# Altium project Touch_Board_LD.PrjPcb
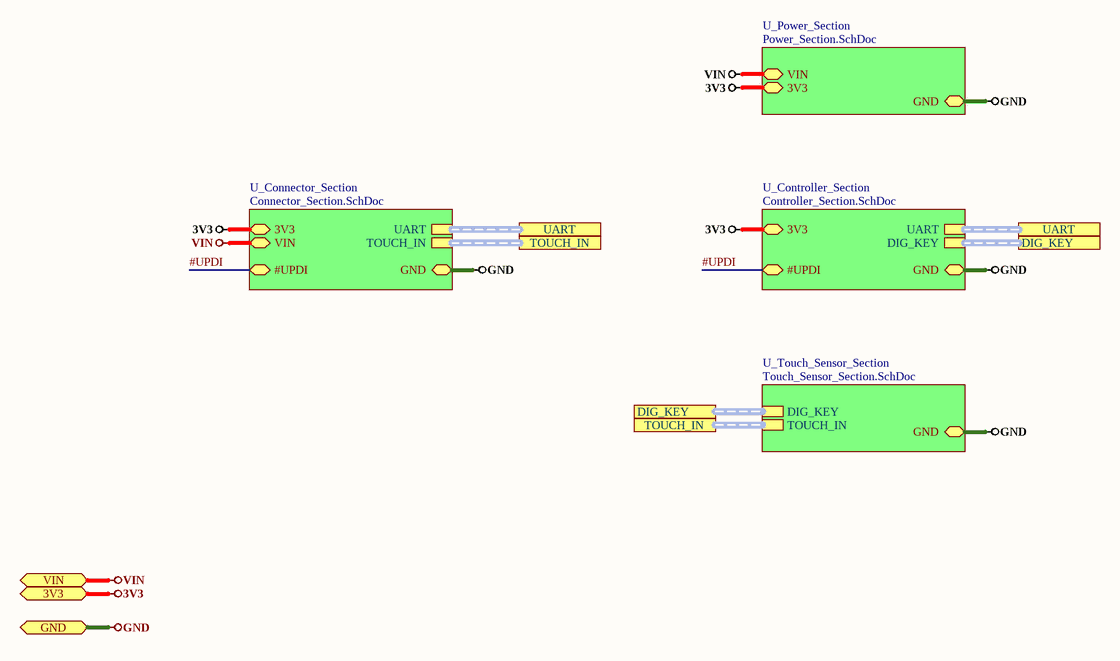
[diagram p0: Top_Sheet.SchDoc]
5 sheets, 34 parts. Net scope: hierarchical (ports join the sheet entries above them; power ports are global).
Board file: Touch_Board_LD.PcbDoc
Sheets:
  Top_Sheet.SchDoc
    U_Connector_Section = Connector_Section.SchDoc
    U_Controller_Section = Controller_Section.SchDoc
    U_Power_Section = Power_Section.SchDoc
    U_Touch_Sensor_Section = Touch_Sensor_Section.SchDoc

## Sheet Top_Sheet.SchDoc
size A4

### Sub-sheets
U_Connector_Section = Connector_Section.SchDoc: 3V3 (bidir), GND (bidir), UART (harness UART_Harness), #UPDI (bidir), TOUCH_IN (harness Touch_Harness), VIN (bidir)
U_Controller_Section = Controller_Section.SchDoc: 3V3 (bidir), GND (bidir), UART (harness UART_Harness), #UPDI (bidir), DIG_KEY (harness Cap_Harness)
U_Power_Section = Power_Section.SchDoc: VIN (bidir), GND (bidir), 3V3 (bidir)
U_Touch_Sensor_Section = Touch_Sensor_Section.SchDoc: GND (bidir), DIG_KEY (harness Cap_Harness), TOUCH_IN (harness Touch_Harness)

### Ports
3V3 (bidir), DIG_KEY (harness Cap_Harness), GND (bidir), TOUCH_IN (harness Touch_Harness), UART (harness UART_Harness), VIN (bidir)

### Nets
3V3: port 3V3, sheet U_Connector_Section/3V3, sheet U_Controller_Section/3V3, sheet U_Power_Section/3V3
GND: port GND, sheet U_Connector_Section/GND, sheet U_Controller_Section/GND, sheet U_Power_Section/GND, sheet U_Touch_Sensor_Section/GND
VIN: port VIN, sheet U_Connector_Section/VIN, sheet U_Power_Section/VIN
#UPDI: sheet U_Connector_Section/#UPDI, sheet U_Controller_Section/#UPDI

### Buses and harness runs
harness port DIG_KEY = sheet U_Controller_Section/DIG_KEY
harness port DIG_KEY = sheet U_Touch_Sensor_Section/DIG_KEY
harness port TOUCH_IN = sheet U_Connector_Section/TOUCH_IN
harness port TOUCH_IN = sheet U_Touch_Sensor_Section/TOUCH_IN
harness port UART = sheet U_Connector_Section/UART
harness port UART = sheet U_Controller_Section/UART

## Sheet Connector_Section.SchDoc
size A4
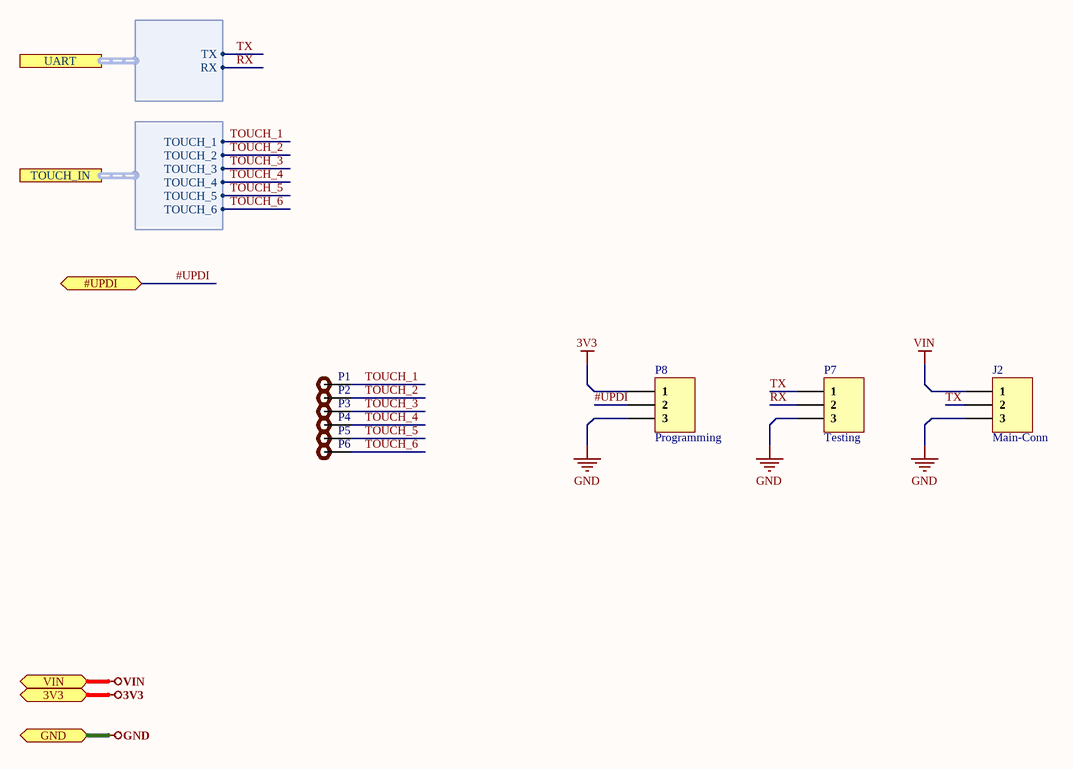
[diagram p1: Connector_Section.SchDoc]

### Parts
J2  Main-Conn  [S3B-XH-A-1(LF)(SN)]
P1  Test Point  [TEST POINT]  (value not drawn)
P2  Test Point  [TEST POINT]  (value not drawn)
P3  Test Point  [TEST POINT]  (value not drawn)
P4  Test Point  [TEST POINT]  (value not drawn)
P5  Test Point  [TEST POINT]  (value not drawn)
P6  Test Point  [TEST POINT]  (value not drawn)
P7  Testing  [HDR1X3]
P8  Programming  [HDR1X3]

### Ports
3V3 (bidir), #UPDI (bidir), GND (bidir), TOUCH_IN (harness Touch_Harness), UART (harness UART_Harness), VIN (bidir)

### Harnesses
UART_Harness: TX, RX
Touch_Harness: TOUCH_1, TOUCH_2, TOUCH_3, TOUCH_4, TOUCH_5, TOUCH_6

### Nets
3V3: P8.1 ; port 3V3
GND: J2.3 P7.3 P8.3 ; port GND
VIN: J2.1 ; port VIN
#UPDI: P8.2 ; port #UPDI
RX: P7.2 ; port UART.RX
TOUCH_1: P1.1 ; port TOUCH_IN.TOUCH_1
TOUCH_2: P2.1 ; port TOUCH_IN.TOUCH_2
TOUCH_3: P3.1 ; port TOUCH_IN.TOUCH_3
TOUCH_4: P4.1 ; port TOUCH_IN.TOUCH_4
TOUCH_5: P5.1 ; port TOUCH_IN.TOUCH_5
TOUCH_6: P6.1 ; port TOUCH_IN.TOUCH_6
TX: J2.2 P7.1 ; port UART.TX

### Library data of the parts
J2 = S3B-XH-A-1(LF)(SN): CONN HEADER XH SIDE 3POS 2.5MM; Manufacturer: JST; Connector Type: Male Pin; Number of Positions: 3; Pitch: 0.098inch; Supplier 1: Digi-Key; Manufacturer Part Number: S3B-XH-A-1(LF)(SN); RoHS: Yes; Category: Connectors; Pricing 1: 1=0.22000, 10=0.20900, 100=0.14520, 500=0.12282, 1000=0.10049, 5000=0.08933, 10000=0.08095 (USD); Mount: Through Hole; Color: Natural; Contact Plating: Tin; Termination: Press-Fit; Package Quantity: 1000; Number of Rows: 1; Packaging: Bulk; Fastening Type: Detent; Lead Free: Lead Free; ComponentLink1URL: https://datasheet.ciiva.com/725/exh-725857.pdf?src-supplier=Digi-Key; ComponentLink1Description: https://datasheet.ciiva.com/725/exh-725857.pdf?src-supplier=Digi-Key; ComponentLink2URL: https://datasheet.ciiva.com/16484/ejq-16484618.pdf?src-supplier=Future+Electronics; ComponentLink2Description: https://datasheet.ciiva.com/16484/ejq-16484618.pdf?src-supplier=Future+Electronics; Supplier Part Number 1: 455-2954-ND
P1-P6 = TEST POINT: Test Point ON
P7 P8 = Header 3: CONN HEADER VERT 3POS 2.54MM; Manufacturer: Wurth Electronics; Manufacturer Part Number: 61300311121; Number of Positions: 3; Gender: Male; Connector Type: Male Pin; Pitch: 0.1inch; Supplier 1: Digi-Key; Stock 1: 81286; Pricing 1: 1=0.13, 10=0.106, 25=0.088, 50=0.074, 100=0.067, 1000=0.061 (USD); Mount: Through Hole; Contact Plating: Gold; Contact Material: Copper; Color: Black; Number of Rows: 1; Packaging: Bulk; Termination: Solder; Number of Contacts: 3; Contact Mating Length: 0.236inch; REACH SVHC: Unknown; Lead Free: Lead Free; ComponentLink1URL: http://www.farnell.com/cad/1737268.pdf?src-supplier=Element14; ComponentLink1Description: http://www.farnell.com/cad/1737268.pdf?src-supplier=Element14; ComponentLink2URL: https://katalog.we-online.de/em/datasheet/6130xx11121.pdf?src-supplier=Digi-Key; ComponentLink2Description: https://katalog.we-online.de/em/datasheet/6130xx11121.pdf?src-supplier=Digi-Key; Supplier Part Number 1: 732-5316-ND

## Sheet Controller_Section.SchDoc
size A4
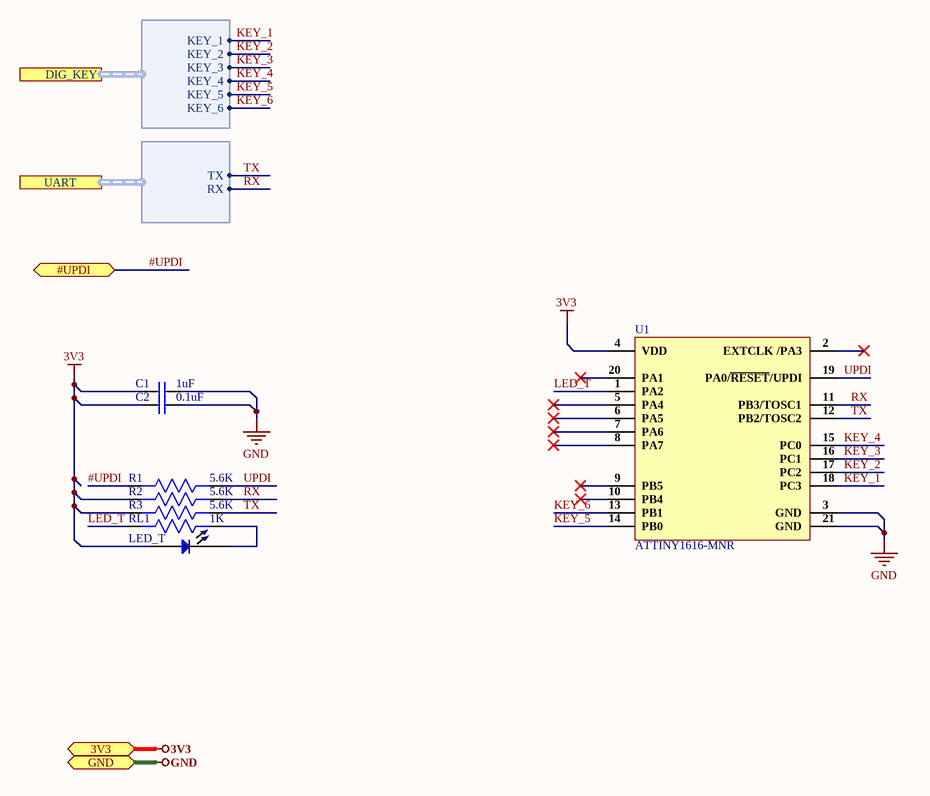
[diagram p2: Controller_Section.SchDoc]

### Parts
C1  1uF  [Cap0603]
C2  0.1uF  [Cap0805]
LED_T  150080GS75000  [LED 0805]  (value not drawn)
R1  5.6K  [RES 0805]
R2  5.6K  [RES 0805]
R3  5.6K  [RES 0805]
RL1  1K  [RES 0805]
U1  ATTINY1616-MNR  [20-QFN]

### Ports
3V3 (bidir), #UPDI (bidir), DIG_KEY (harness Cap_Harness), GND (bidir), UART (harness UART_Harness)

### Harnesses
Cap_Harness: KEY_1, KEY_2, KEY_3, KEY_4, KEY_5, KEY_6
UART_Harness: TX, RX

### Nets
3V3: C1.1 C2.1 LED_T.1 R2.2 R3.2 U1.4(VDD) ; port 3V3
GND: C1.2 C2.2 U1.3(GND) U1.21(GND) ; port GND
#UPDI: R1.2 ; port #UPDI
KEY_1: U1.18(PC3) ; port DIG_KEY.KEY_1
KEY_2: U1.17(PC2) ; port DIG_KEY.KEY_2
KEY_3: U1.16(PC1) ; port DIG_KEY.KEY_3
KEY_4: U1.15(PC0) ; port DIG_KEY.KEY_4
KEY_5: U1.14(PB0) ; port DIG_KEY.KEY_5
KEY_6: U1.13(PB1) ; port DIG_KEY.KEY_6
LED_T: RL1.2 U1.1(PA2)
RX: R2.1 U1.11(PB3/TOSC1) ; port UART.RX
TX: R3.1 U1.12(PB2/TOSC2) ; port UART.TX
UPDI: R1.1 U1.19(PA0/~{RESET}/UPDI)
NetLED_T_2: LED_T.2 RL1.1

Not connected (* = marked no-connect by the designer): U1 2(EXTCLK_/PA3)* 5(PA4)* 6(PA5)* 7(PA6)* 8(PA7)* 9(PB5)* 10(PB4)* 20(PA1)*

### Library data of the parts
C1 = CC0603KRX5R8BB105: CAP CER 1UF 25V X5R 0603; Manufacturer: Yageo; Tolerance: 10%; Supplier 1: Digi-Key; Manufacturer Part Number: CC0603KRX5R8BB105; RoHS: Yes; Category: Ceramic Capacitors; Stock 1: 919939; Pricing 1: 1=0.12000, 10=0.08400, 50=0.04760, 100=0.03940, 500=0.02764, 1000=0.02288 (USD); Mount: Surface Mount; Case/Package: 0603; Number of Pins: 2; Case Code (Metric): 1608; Case Code (Imperial): 0603; Min Operating Temperature: -55°C; Max Operating Temperature: 85°C; Capacitance: 1uF; Dielectric: X5R; Package Quantity: 1; Voltage Rating: 25V; Packaging: Tape and Reel; Termination: SMD/SMT; Voltage Rating (DC): 25V; Series: CC; Construction: Flat; Length: 1.6mm; Width: 0.031inch; Height: 0.8mm; Thickness: 0.035inch; Depth: 0.8mm; Radiation Hardening: No; REACH SVHC: No SVHC; Lead Free: Lead Free; Halogen Free: Halogen Free; RoHS Compliant: Yes; ComponentLink1URL: https://datasheet.ciiva.com/176/mlccorderingcode-176785.pdf?src-supplier=Digi-Key; ComponentLink1Description: https://datasheet.ciiva.com/176/mlccorderingcode-176785.pdf?src-supplier=Digi-Key; ComponentLink2URL: https://datasheet.ciiva.com/176/mlccorderingcode-176786.pdf?src-supplier=Digi-Key; ComponentLink2Description: https://datasheet.ciiva.com/176/mlccorderingcode-176786.pdf?src-supplier=Digi-Key; ComponentLink3URL: https://datasheet.ciiva.com/176/mlccorderingcode-176787.pdf?src-supplier=Digi-Key; ComponentLink3Description: https://datasheet.ciiva.com/176/mlccorderingcode-176787.pdf?src-supplier=Digi-Key; ComponentLink4URL: https://datasheet.ciiva.com/17436/upy-gphc-x5r-4v-to-50v-12-17436952.pdf?src-supplier=Avnet+Europe; ComponentLink4Description: https://datasheet.ciiva.com/17436/upy-gphc-x5r-4v-to-50v-12-17436952.pdf?src-supplier=Avnet+Europe; ComponentLink5URL: https://datasheet.ciiva.com/7978/1525783-7978171.pdf?src-supplier=Element14; ComponentLink5Description: https://datasheet.ciiva.com/7978/1525783-7978171.pdf?src-supplier=Element14; ComponentLink6URL: https://datasheet.ciiva.com/11586/upy-gphc-x5r-4v-to-50v-12-11586318.pdf?src-supplier=Avnet; ComponentLink6Description: https://datasheet.ciiva.com/11586/upy-gphc-x5r-4v-to-50v-12-11586318.pdf?src-supplier=Avnet; Supplier Part Number 1: 311-1445-1-ND
C2 = 0805B104K500CT: CAP CER 0.1UF 50V X7R 0805; Manufacturer: Walsin Technologies; Tolerance: 10%; Capacitance: 100nF; Supplier 1: Digi-Key; Manufacturer Part Number: 0805B104K500CT; RoHS: Yes; Category: Ceramic Capacitors; Stock 1: 1274242; Pricing 1: 1=0.12000, 10=0.08600, 50=0.04900, 100=0.04050, 500=0.02842, 1000=0.02352 (USD); Case/Package: 0805; Case Code (Imperial): 0805; Case Code (Metric): 2012; Min Operating Temperature: -55°C; Max Operating Temperature: 125°C; Packaging: Tape and Reel; Voltage Rating: 50V; Dielectric: X7R; Voltage Rating (DC): 50V; Voltage: 50V; Length: 2mm; Depth: 1.25mm; Radiation Hardening: No; REACH SVHC: Unknown; Lead Free: Lead Free; ComponentLink1URL: http://www.farnell.com/datasheets/2340522.pdf?src-supplier=Farnell; ComponentLink1Description: http://www.farnell.com/datasheets/2340522.pdf?src-supplier=Farnell; ComponentLink2URL: http://components.arrow.com/part/dataview/0323_00650840?src-supplier=Arrow+Europe; ComponentLink2Description: http://components.arrow.com/part/dataview/0323_00650840?src-supplier=Arrow+Europe; ComponentLink3URL: https://www.verical.com/server-webapp/html/getDatasheet?partID=414849&src-supplier=Verical; ComponentLink3Description: https://www.verical.com/server-webapp/html/getDatasheet?partID=414849&src-supplier=Verical; ComponentLink4URL: http://www.farnell.com/datasheets/2340522.pdf?src-supplier=Element14; ComponentLink4Description: http://www.farnell.com/datasheets/2340522.pdf?src-supplier=Element14; ComponentLink5URL: http://www.passivecomponent.com/wp-content/uploads/2018/10/MLCC.pdf?src-supplier=Digi-Key; ComponentLink5Description: http://www.passivecomponent.com/wp-content/uploads/2018/10/MLCC.pdf?src-supplier=Digi-Key; ComponentLink6URL: http://www.passivecomponent.com/indexsea/0805B104K500CT-IB.pdf?src-supplier=Digi-Key; ComponentLink6Description: http://www.passivecomponent.com/indexsea/0805B104K500CT-IB.pdf?src-supplier=Digi-Key; ComponentLink7URL: http://www.farnell.com/datasheets/2340522.pdf?src-supplier=Newark; ComponentLink7Description: http://www.farnell.com/datasheets/2340522.pdf?src-supplier=Newark; Supplier Part Number 1: 1292-1647-1-ND
LED_T = 150080GS75000: LED GREEN CLEAR 0805 SMD; Manufacturer: Wurth Electronics; Viewing Angle: 140°; Lens Style: Clear,Rectangular; Luminous Intensity: 450mcd; Forward Voltage: 3.2V; Wavelength: 520nm; Forward Current: 30mA; Test Current: 20mA; Supplier 1: Digi-Key; Manufacturer Part Number: 150080GS75000; RoHS: Yes; Category: LEDs; Stock 1: 96823; Pricing 1: 1=0.18000, 50=0.16500, 100=0.14200, 500=0.12300 (USD); Mount: Surface Mount; Case/Package: 0805; Color: Green; Case Code (Metric): 2012; Case Code (Imperial): 0805; Min Operating Temperature: -40°C; Max Operating Temperature: 85°C; Package Quantity: 4000; Packaging: Cut Tape; Dominant Wavelength: 520nm; Length: 2mm; Width: 1.25mm; Height: 0.7mm; REACH SVHC: Unknown; RoHS Compliant: Yes; ComponentLink1URL: https://datasheet.ciiva.com/29563/150080gs75000-29563008.pdf?src-supplier=Digi-Key; ComponentLink1Description: https://datasheet.ciiva.com/29563/150080gs75000-29563008.pdf?src-supplier=Digi-Key; ComponentLink2URL: https://datasheet.ciiva.com/29279/759434-da-01-en-chipled-0805-w-kl-gruen-150080gs75000-29279039.pdf?src-supplier=Conrad; ComponentLink2Description: https://datasheet.ciiva.com/29279/759434-da-01-en-chipled-0805-w-kl-gruen-150080gs75000-29279039.pdf?src-supplier=Conrad; Supplier Part Number 1: 732-4983-1-ND
R1-R3 = ERJ6ENF5601V: RES SMD 5.6K Ohm 1% 0805; Manufacturer: Panasonic; Manufacturer Part Number: ERJ-6ENF5601V; Resistance: 5.6kR; Temperature Coefficient: 100ppm/°C; Power Rating: 125mW; Voltage Rating: 150V; Supplier 1: Digi-Key; RoHS: Yes; Category: Chip SMD Resistors; Stock 1: 4806; Pricing 1: 1=0.10000, 10=0.07500, 100=0.02880, 1000=0.01265, 2500=0.01092 (USD); Mount: Surface Mount; Case/Package: 0805; Number of Pins: 2; Contact Plating: Tin; Case Code (Metric): 2012; Case Code (Imperial): 0805; Min Operating Temperature: -55°C; Max Operating Temperature: 155°C; Tolerance: 1%; Resistor Type: Thick Film; Packaging: Tape and Reel; Package Quantity: 1; Number of Terminations: 2; Termination: SMD/SMT; Max Power Dissipation: 125mW; Voltage Rating (DC): 150V; Features: Automotive AEC-Q200; Series: ERJ; Technology: THICK FILM; Resistance Tolerance: 1%; Construction: Rectangular; Length: 2mm; Width: 0.049inch; Height: 0.6mm; Depth: 1.25mm; Radiation Hardening: No; REACH SVHC: No SVHC; Military Standard: Not; Lead Free: Lead Free; RoHS Compliant: Yes; ComponentLink1URL: https://datasheet.ciiva.com/11821/0900766b80f80784-11821697.pdf?src-supplier=RSComponents; ComponentLink1Description: https://datasheet.ciiva.com/11821/0900766b80f80784-11821697.pdf?src-supplier=RSComponents; ComponentLink2URL: https://datasheet.ciiva.com/9195/aoa0000ce2-9195464.pdf?src-supplier=Avnet; ComponentLink2Description: https://datasheet.ciiva.com/9195/aoa0000ce2-9195464.pdf?src-supplier=Avnet; ComponentLink3URL: https://datasheet.ciiva.com/6138/426256-6138793.pdf?src-supplier=Farnell; ComponentLink3Description: https://datasheet.ciiva.com/6138/426256-6138793.pdf?src-supplier=Farnell; ComponentLink4URL: https://datasheet.ciiva.com/30195/aoa0000ce2-30195103.pdf?src-supplier=Onlinecomponents.com; ComponentLink4Description: https://datasheet.ciiva.com/30195/aoa0000ce2-30195103.pdf?src-supplier=Onlinecomponents.com; ComponentLink5URL: https://datasheet.ciiva.com/17212/aoa0000ce2-17212901.pdf?src-supplier=Avnet+Europe; ComponentLink5Description: https://datasheet.ciiva.com/17212/aoa0000ce2-17212901.pdf?src-supplier=Avnet+Europe; ComponentLink6URL: https://datasheet.ciiva.com/22737/426256-22737287.pdf?src-supplier=Element14; ComponentLink6Description: https://datasheet.ciiva.com/22737/426256-22737287.pdf?src-supplier=Element14; ComponentLink7URL: https://datasheet.ciiva.com/46420/1678782-46420327.pdf?src-supplier=Element14; ComponentLink7Description: https://datasheet.ciiva.com/46420/1678782-46420327.pdf?src-supplier=Element14; ComponentLink8URL: https://datasheet.ciiva.com/16784/70260748-16784840.pdf?src-supplier=Allied+Electronics; ComponentLink8Description: https://datasheet.ciiva.com/16784/70260748-16784840.pdf?src-supplier=Allied+Electronics; ComponentLink9URL: https://datasheet.ciiva.com/16771/70260748-16771098.pdf?src-supplier=Allied+Electronics; ComponentLink9Description: https://datasheet.ciiva.com/16771/70260748-16771098.pdf?src-supplier=Allied+Electronics; ComponentLink10URL: https://datasheet.ciiva.com/16512/aoa0000ce2-16512011.pdf?src-supplier=Avnet+Asia; ComponentLink10Description: https://datasheet.ciiva.com/16512/aoa0000ce2-16512011.pdf?src-supplier=Avnet+Asia; ComponentLink11URL: https://datasheet.ciiva.com/22673/1678782-22673707.pdf?src-supplier=Element14; ComponentLink11Description: https://datasheet.ciiva.com/22673/1678782-22673707.pdf?src-supplier=Element14; ComponentLink12URL: https://datasheet.ciiva.com/24024/aoa0000ce2-24024829.pdf?src-supplier=Mouser; ComponentLink12Description: https://datasheet.ciiva.com/24024/aoa0000ce2-24024829.pdf?src-supplier=Mouser; Supplier Part Number 1: P5.60KCCT-ND
RL1 = CRCW08051K00JNEB: RES SMD 1K OHM 5% 1/8W 0805; Manufacturer: Vishay Dale; Resistance: 1kR; Power Rating: 125mW; Voltage Rating: 150V; Temperature Coefficient: 200ppm/°C; Supplier 1: Digi-Key; Manufacturer Part Number: CRCW08051K00JNEB; RoHS: Yes; Category: Chip SMD Resistors; Stock 1: 4389; Pricing 1: 1=0.10000, 10=0.05000, 100=0.02040, 1000=0.00914, 2500=0.00794, 5000=0.00656 (USD); Case/Package: 0805; Number of Pins: 2; Weight: 0.000194oz; Case Code (Imperial): 0805; Case Code (Metric): 2012; Contact Plating: Tin; Min Operating Temperature: -55°C; Max Operating Temperature: 155°C; Packaging: Tape and Reel; Tolerance: 5%; Package Quantity: 10000; Resistor Type: Thick Film; Number of Terminations: 2; Termination: SMD/SMT; Max Power Dissipation: 125mW; Voltage Rating (DC): 150V; Features: Automotive AEC-Q200; Length: 0.079inch; Width: 0.049inch; Height: 0.02inch; Radiation Hardening: No; REACH SVHC: Unknown; Lead Free: Lead Free; ComponentLink1URL: https://datasheet.ciiva.com/5548/dcrcwe3-109170-5548326.pdf?src-supplier=Mouser; ComponentLink1Description: https://datasheet.ciiva.com/5548/dcrcwe3-109170-5548326.pdf?src-supplier=Mouser; ComponentLink2URL: https://datasheet.ciiva.com/28621/1747939-28621434.pdf?src-supplier=Element14; ComponentLink2Description: https://datasheet.ciiva.com/28621/1747939-28621434.pdf?src-supplier=Element14; Supplier Part Number 1: 541-CRCW08051K00JNEBCT-ND
U1 = ATTINY1616-MNR: IC MCU 8BIT 16KB FLASH 20VQFN; Manufacturer: Microchip; Interface: I2C,SPI,IrDA,UART,USART; Peripherals: Brown-out Detect/Reset,POR,PWM,WDT; Core Architecture: AVR; Frequency: 20MHz; Number of I/Os: 18; Oscillator Type: Internal; Supplier 1: Digi-Key; Manufacturer Part Number: ATTINY1616-MNR; RoHS: No; Category: Microcontrollers; Stock 1: 3963; Pricing 1: 1=0.75000, 25=0.69000, 100=0.62000 (USD); Case/Package: VQFN; Min Operating Temperature: -40°C; Max Operating Temperature: 105°C; Memory Type: FLASH; Packaging: Cut Tape; Memory Size: 16KB; ComponentLink1URL: http://www.microchip.com/mymicrochip/filehandler.aspx?ddocname=en606269&src-supplier=Digi-Key; ComponentLink1Description: http://www.microchip.com/mymicrochip/filehandler.aspx?ddocname=en606269&src-supplier=Digi-Key; Supplier Part Number 1: ATTINY1616-MNRCT-ND

## Sheet Power_Section.SchDoc
size A4
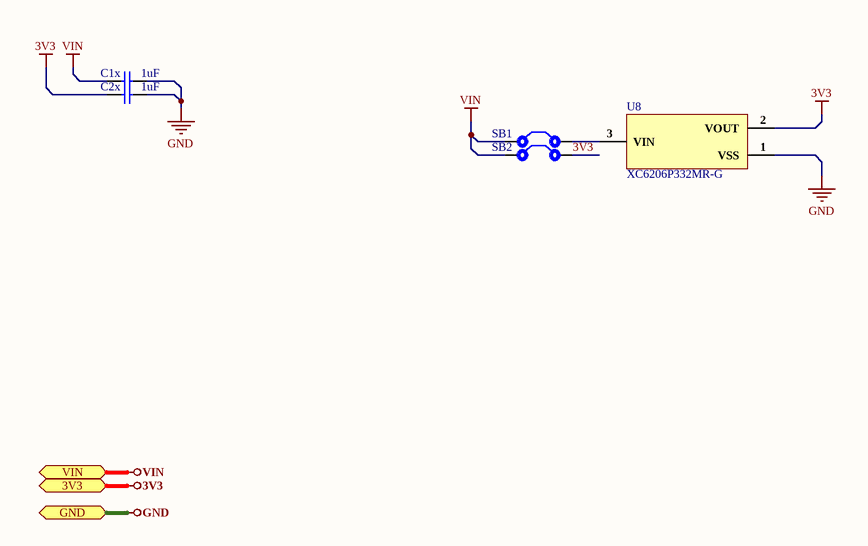
[diagram p3: Power_Section.SchDoc]

### Parts
C1x  1uF  [Cap0603]
C2x  1uF  [Cap0603]
SB1  Solder Bridge  [Solder Bridge]  (value not drawn)
SB2  Solder Bridge  [Solder Bridge]  (value not drawn)
U8  XC6206P332MR-G  [sot-23]

### Ports
3V3 (bidir), GND (bidir), VIN (bidir)

### Nets
3V3: C2x.1 SB2.2 U8.2(VOUT) ; port 3V3
GND: C1x.2 C2x.2 U8.1(VSS) ; port GND
VIN: C1x.1 SB1.1 SB2.1 ; port VIN
NetSB1_2: SB1.2 U8.3(VIN)

### Library data of the parts
C1x C2x = CC0603KRX5R8BB105: as C1 on sheet Controller_Section; Supplier 1: Digi-Key; Manufacturer Part Number: CC0603KRX5R8BB105; RoHS: Yes; Category: Ceramic Capacitors; Stock 1: 919939; Pricing 1: 1=0.12000, 10=0.08400, 50=0.04760, 100=0.03940, 500=0.02764, 1000=0.02288 (USD); Mount: Surface Mount; Case/Package: 0603; Number of Pins: 2; Case Code (Metric): 1608; Case Code (Imperial): 0603; Min Operating Temperature: -55°C; Max Operating Temperature: 85°C; Capacitance: 1uF; Dielectric: X5R; Package Quantity: 1; Voltage Rating: 25V; Packaging: Tape and Reel; Termination: SMD/SMT; Voltage Rating (DC): 25V; Series: CC; Construction: Flat; Length: 1.6mm; Width: 0.031inch; Height: 0.8mm; Thickness: 0.035inch; Depth: 0.8mm; Radiation Hardening: No; REACH SVHC: No SVHC; Lead Free: Lead Free; Halogen Free: Halogen Free; RoHS Compliant: Yes; ComponentLink1URL: https://datasheet.ciiva.com/176/mlccorderingcode-176785.pdf?src-supplier=Digi-Key; ComponentLink1Description: https://datasheet.ciiva.com/176/mlccorderingcode-176785.pdf?src-supplier=Digi-Key; ComponentLink2URL: https://datasheet.ciiva.com/176/mlccorderingcode-176786.pdf?src-supplier=Digi-Key; ComponentLink2Description: https://datasheet.ciiva.com/176/mlccorderingcode-176786.pdf?src-supplier=Digi-Key; ComponentLink3URL: https://datasheet.ciiva.com/176/mlccorderingcode-176787.pdf?src-supplier=Digi-Key; ComponentLink3Description: https://datasheet.ciiva.com/176/mlccorderingcode-176787.pdf?src-supplier=Digi-Key; ComponentLink4URL: https://datasheet.ciiva.com/17436/upy-gphc-x5r-4v-to-50v-12-17436952.pdf?src-supplier=Avnet+Europe; ComponentLink4Description: https://datasheet.ciiva.com/17436/upy-gphc-x5r-4v-to-50v-12-17436952.pdf?src-supplier=Avnet+Europe; ComponentLink5URL: https://datasheet.ciiva.com/7978/1525783-7978171.pdf?src-supplier=Element14; ComponentLink5Description: https://datasheet.ciiva.com/7978/1525783-7978171.pdf?src-supplier=Element14; ComponentLink6URL: https://datasheet.ciiva.com/11586/upy-gphc-x5r-4v-to-50v-12-11586318.pdf?src-supplier=Avnet; ComponentLink6Description: https://datasheet.ciiva.com/11586/upy-gphc-x5r-4v-to-50v-12-11586318.pdf?src-supplier=Avnet; Supplier Part Number 1: 311-1445-1-ND
SB1 SB2 = Solder Bridge: Solder Bridge ON
U8 = XC6206P332MR-G: IC REG LINEAR 3.3V 200MA SOT23; Manufacturer: Torex; Output Type: Fixed; Output Configuration: Positive; Number of Regulators: 1; Max Input Voltage: 6V; Dropout Voltage: 680mV; Quiescent Current: 3uA; Supplier 1: Avnet; Manufacturer Part Number: XC6206P332MR-G; RoHS: Yes; Category: Voltage Regulators - Linear; Pricing 1: 3000=0.23146, 6000=0.22820, 12000=0.22168, 18000=0.21679, 24000=0.20864, 30000=0.20375, 300000=0.19886 (USD); Mount: Surface Mount; Case/Package: TO-236-3; Min Operating Temperature: -40°C; Max Operating Temperature: 85°C; Min Output Voltage: 3.3V; Output Current: 200mA; Max Supply Current: 3uA; RoHS Compliant: Yes; ComponentLink1URL: https://www.torexsemi.com/file/xc6206/XC6206.pdf?src-supplier=Digi-Key; ComponentLink1Description: https://www.torexsemi.com/file/xc6206/XC6206.pdf?src-supplier=Digi-Key; Supplier Part Number 1: XC6206P332MR-G

## Sheet Touch_Sensor_Section.SchDoc
size A4
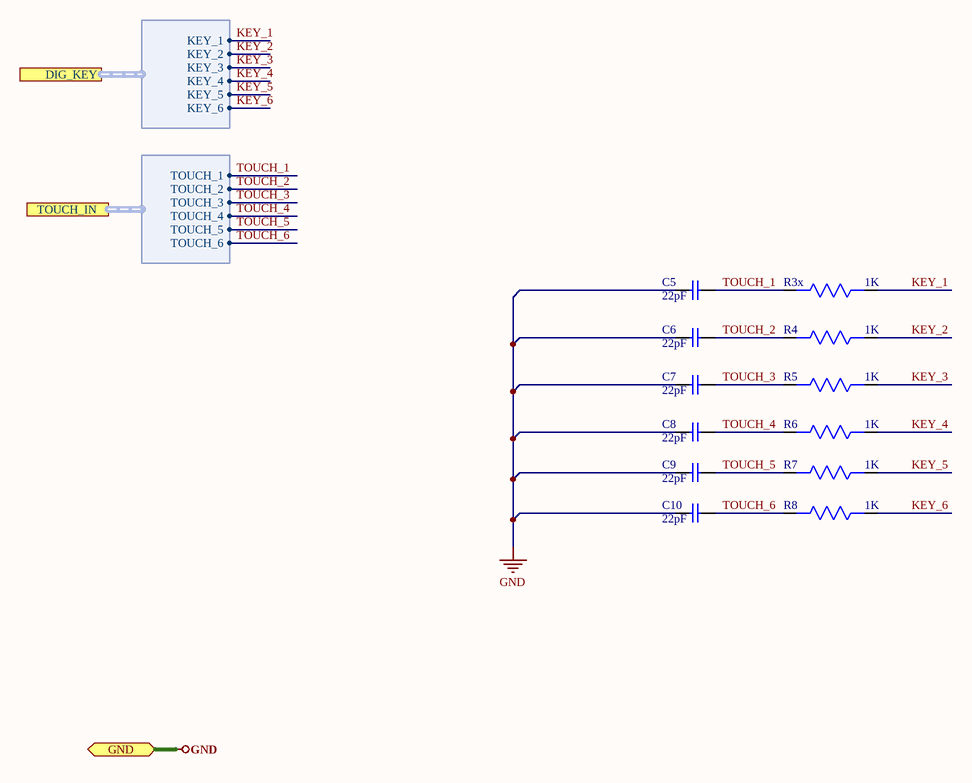
[diagram p4: Touch_Sensor_Section.SchDoc]

### Parts
C5  22pF  [Cap0805]
C6  22pF  [Cap0805]
C7  22pF  [Cap0805]
C8  22pF  [Cap0805]
C9  22pF  [Cap0805]
C10  22pF  [Cap0805]
R3x  1K  [RES 0805]
R4  1K  [RES 0805]
R5  1K  [RES 0805]
R6  1K  [RES 0805]
R7  1K  [RES 0805]
R8  1K  [RES 0805]

### Ports
DIG_KEY (harness Cap_Harness), GND (bidir), TOUCH_IN (harness Touch_Harness)

### Harnesses
Cap_Harness: KEY_1, KEY_2, KEY_3, KEY_4, KEY_5, KEY_6
Touch_Harness: TOUCH_1, TOUCH_2, TOUCH_3, TOUCH_4, TOUCH_5, TOUCH_6

### Nets
GND: C5.1 C6.1 C7.1 C8.1 C9.1 C10.1 ; port GND
KEY_1: R3x.1 ; port DIG_KEY.KEY_1
KEY_2: R4.1 ; port DIG_KEY.KEY_2
KEY_3: R5.1 ; port DIG_KEY.KEY_3
KEY_4: R6.1 ; port DIG_KEY.KEY_4
KEY_5: R7.1 ; port DIG_KEY.KEY_5
KEY_6: R8.1 ; port DIG_KEY.KEY_6
TOUCH_1: C5.2 R3x.2 ; port TOUCH_IN.TOUCH_1
TOUCH_2: C6.2 R4.2 ; port TOUCH_IN.TOUCH_2
TOUCH_3: C7.2 R5.2 ; port TOUCH_IN.TOUCH_3
TOUCH_4: C8.2 R6.2 ; port TOUCH_IN.TOUCH_4
TOUCH_5: C9.2 R7.2 ; port TOUCH_IN.TOUCH_5
TOUCH_6: C10.2 R8.2 ; port TOUCH_IN.TOUCH_6

### Library data of the parts
C5-C10 = AC0805JRNPO9BN220: CAP CER 22PF 50V NPO 0805; Manufacturer: Yageo; Supplier 1: Digi-Key; Manufacturer Part Number: AC0805JRNPO9BN220; RoHS: Yes; Category: Ceramic Capacitors; Stock 1: 633; Pricing 1: 1=0.18000, 10=0.12900, 50=0.07320, 100=0.06060, 500=0.04250, 1000=0.03519 (USD); RoHS Compliant: Yes; Supplier Part Number 1: 311-3136-1-ND
R3x R4-R8 = CRCW08051K00JNEB: as RL1 on sheet Controller_Section; Supplier 1: Digi-Key; Manufacturer Part Number: CRCW08051K00JNEB; RoHS: Yes; Category: Chip SMD Resistors; Stock 1: 4389; Pricing 1: 1=0.10000, 10=0.05000, 100=0.02040, 1000=0.00914, 2500=0.00794, 5000=0.00656 (USD); Case/Package: 0805; Number of Pins: 2; Weight: 0.000194oz; Case Code (Imperial): 0805; Case Code (Metric): 2012; Contact Plating: Tin; Min Operating Temperature: -55°C; Max Operating Temperature: 155°C; Packaging: Tape and Reel; Tolerance: 5%; Package Quantity: 10000; Resistor Type: Thick Film; Number of Terminations: 2; Termination: SMD/SMT; Max Power Dissipation: 125mW; Voltage Rating (DC): 150V; Features: Automotive AEC-Q200; Length: 0.079inch; Width: 0.049inch; Height: 0.02inch; Radiation Hardening: No; REACH SVHC: Unknown; Lead Free: Lead Free; ComponentLink1URL: https://datasheet.ciiva.com/5548/dcrcwe3-109170-5548326.pdf?src-supplier=Mouser; ComponentLink1Description: https://datasheet.ciiva.com/5548/dcrcwe3-109170-5548326.pdf?src-supplier=Mouser; ComponentLink2URL: https://datasheet.ciiva.com/28621/1747939-28621434.pdf?src-supplier=Element14; ComponentLink2Description: https://datasheet.ciiva.com/28621/1747939-28621434.pdf?src-supplier=Element14; Supplier Part Number 1: 541-CRCW08051K00JNEBCT-ND

## Nets that join several sheets
3V3: Connector_Section (P8.1), Controller_Section (6 pins), Power_Section (C2x.1 SB2.2 U8.2)
GND: Connector_Section (J2.3 P7.3 P8.3), Controller_Section (C1.2 C2.2 U1.3 U1.21), Power_Section (C1x.2 C2x.2 U8.1), Touch_Sensor_Section (6 pins)
VIN: Connector_Section (J2.1), Power_Section (C1x.1 SB1.1 SB2.1)
#UPDI: Connector_Section (P8.2), Controller_Section (R1.2)
KEY_1: Controller_Section (U1.18), Touch_Sensor_Section (R3x.1)
KEY_2: Controller_Section (U1.17), Touch_Sensor_Section (R4.1)
KEY_3: Controller_Section (U1.16), Touch_Sensor_Section (R5.1)
KEY_4: Controller_Section (U1.15), Touch_Sensor_Section (R6.1)
KEY_5: Controller_Section (U1.14), Touch_Sensor_Section (R7.1)
KEY_6: Controller_Section (U1.13), Touch_Sensor_Section (R8.1)
RX: Connector_Section (P7.2), Controller_Section (R2.1 U1.11)
TOUCH_1: Connector_Section (P1.1), Touch_Sensor_Section (C5.2 R3x.2)
TOUCH_2: Connector_Section (P2.1), Touch_Sensor_Section (C6.2 R4.2)
TOUCH_3: Connector_Section (P3.1), Touch_Sensor_Section (C7.2 R5.2)
TOUCH_4: Connector_Section (P4.1), Touch_Sensor_Section (C8.2 R6.2)
TOUCH_5: Connector_Section (P5.1), Touch_Sensor_Section (C9.2 R7.2)
TOUCH_6: Connector_Section (P6.1), Touch_Sensor_Section (C10.2 R8.2)
TX: Connector_Section (J2.2 P7.1), Controller_Section (R3.1 U1.12)